# Altium schematic sheet 04_Ethernet.SchDoc
size A3; SheetNumber: 4; SheetTotal: 12
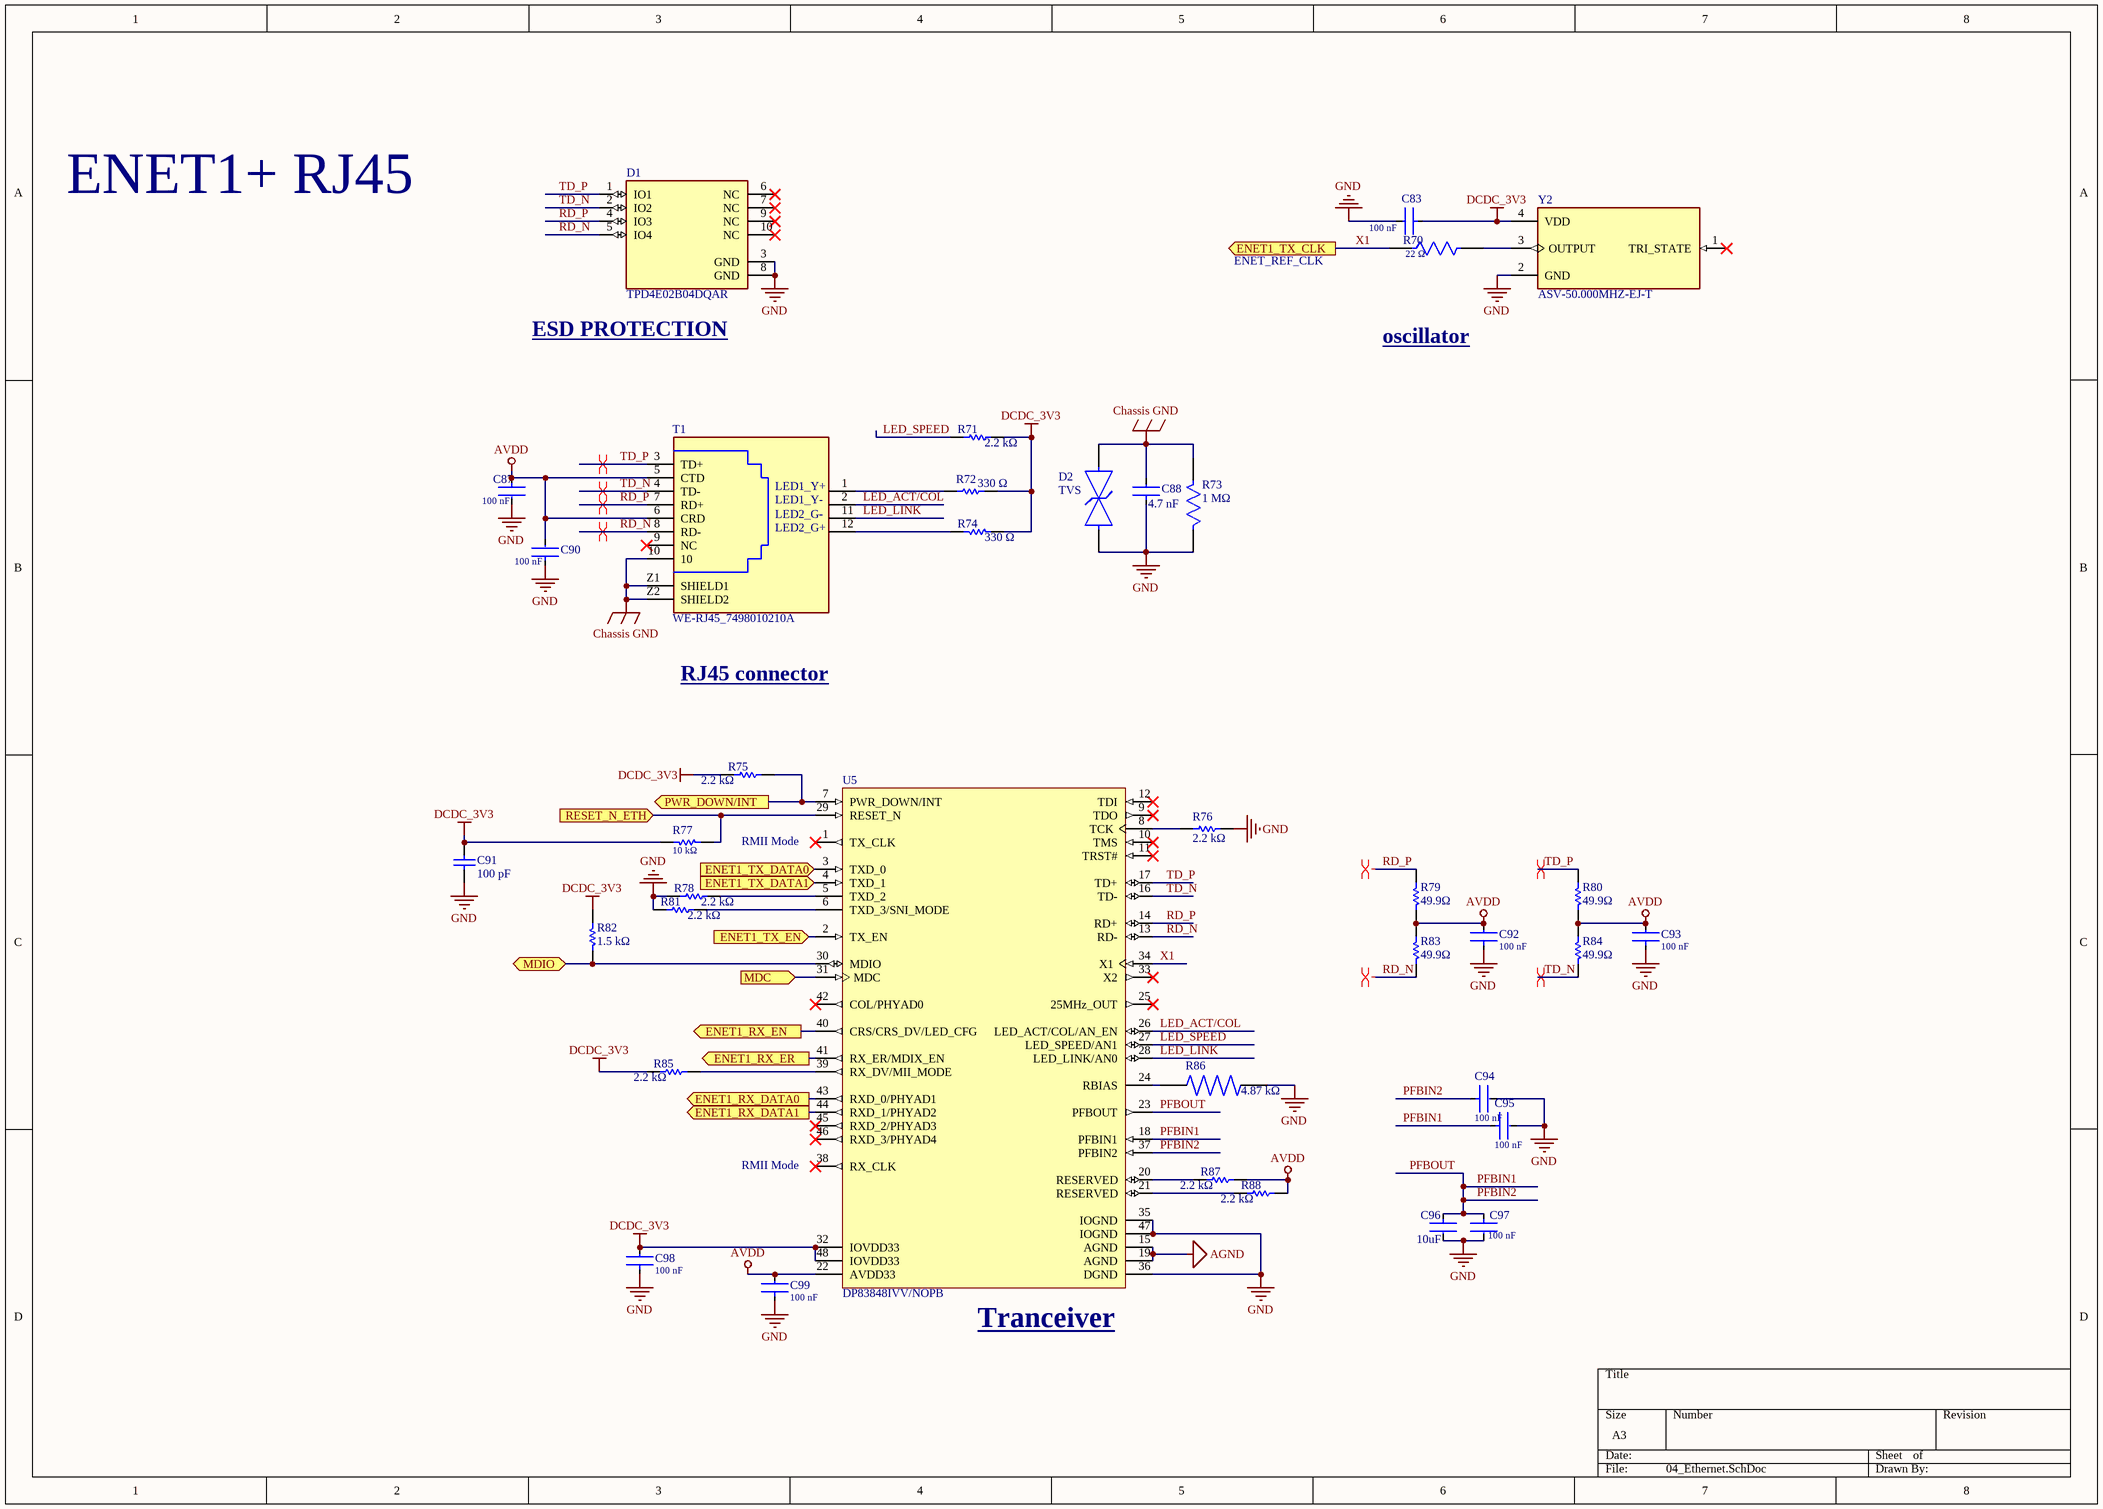
[diagram p0: 04_Ethernet.SchDoc]

## Parts
C83  100 nF  [FP-CC0603-DA-MFG]
C87  100 nF  [FP-CC0603-DA-MFG]
C88  4.7 nF  [FP-C1210C472KGRAC7800-MFG]
C90  100 nF  [FP-CC0603-DA-MFG]
C91  100 pF  [CAPC1608X90X40ML10T20]
C92  100 nF  [FP-CC0603-DA-MFG]
C93  100 nF  [FP-CC0603-DA-MFG]
C94  100 nF  [FP-CC0603-DA-MFG]
C95  100 nF  [FP-CC0603-DA-MFG]
C96  10uF  [FP-CC0603-DC-IPC_C]
C97  100 nF  [FP-CC0603-DA-MFG]
C98  100 nF  [FP-CC0603-DA-MFG]
C99  100 nF  [FP-CC0603-DA-MFG]
D1  TPD4E02B04DQAR  [FP-DQA0010A-MFG]
D2  TVS  [FP-SMBJ-CA-MFG]
R70  22 Ω  [FP-RC0603-0_55-IPC_C]
R71  2.2 kΩ  [RESC1608X55X25LL10T15]
R72  330 Ω  [RESC1608X55X25ML10T15]
R73  1 MΩ  [FP-CRCW1206-e3-MFG]
R74  330 Ω  [RESC1608X55X25ML10T15]
R75  2.2 kΩ  [RESC1608X55X25LL10T15]
R76  2.2 kΩ  [RESC1608X55X25LL10T15]
R77  10 kΩ  [RESC1608X55X25ML10T15]
R78  2.2 kΩ  [RESC1608X55X25LL10T15]
R79  49.9Ω  [RESC1608X55X25ML10T15]
R80  49.9Ω  [RESC1608X55X25ML10T15]
R81  2.2 kΩ  [RESC1608X55X25LL10T15]
R82  1.5 kΩ  [RESC1608X55X25ML10T15]
R83  49.9Ω  [RESC1608X55X25ML10T15]
R84  49.9Ω  [RESC1608X55X25ML10T15]
R85  2.2 kΩ  [RESC1608X55X25LL10T15]
R86  4.87 kΩ  [RESC1608X55N]
R87  2.2 kΩ  [RESC1608X55X25LL10T15]
R88  2.2 kΩ  [RESC1608X55X25LL10T15]
T1  WE-RJ45_7498010210A  [J00-00XXNL]
U5  DP83848IVV/NOPB  [PT0048A_N]
Y2  ASV-50.000MHZ-EJ-T  [ASV-50.000MHZ-EJ-T_ABR]

## Ports
ENET1_RX_DATA0 (out), ENET1_RX_DATA1 (out), ENET1_RX_EN (out), ENET1_RX_ER (out), ENET1_TX_CLK (out), ENET1_TX_DATA0 (in), ENET1_TX_DATA1 (in), ENET1_TX_EN (in), MDC (in), MDIO (bidir), PWR_DOWN/INT (out), RESET_N_ETH (in)

## Nets
AGND: U5.15(AGND) U5.19(AGND)
AVDD: C87.1 C90.2 C92.2 C93.2 C99.2 R79.1 R80.1 R83.2 R84.2 R87.2 R88.2 T1.5(CTD) T1.6(CRD) U5.22(AVDD33)
Chassis GND: C88.2 D2.2 R73.2 T1.10 T1.Z1(SHIELD1) T1.Z2(SHIELD2)
DCDC_3V3: C83.1 C91.2 C98.2 R71.2 R72.2 R74.2 R75.2 R77.2 R82.2 R85.1 U5.32(IOVDD33) U5.48(IOVDD33) Y2.4(VDD)
GND: C83.2 C87.2 C88.1 C90.1 C91.1 C92.1 C93.1 C94.2 C95.2 C96.2 C97.2 C98.1 C99.1 D1.3(GND) D1.8(GND) D2.1 R73.1 R76.2 R78.1 R81.1 R86.2 U5.35(IOGND) U5.36(DGND) U5.47(IOGND) Y2.2(GND)
ENET1_RX_DATA0: U5.43(RXD_0/PHYAD1) ; port ENET1_RX_DATA0
ENET1_RX_DATA1: U5.44(RXD_1/PHYAD2) ; port ENET1_RX_DATA1
ENET1_RX_EN: U5.40(CRS/CRS_DV/LED_CFG) ; port ENET1_RX_EN
ENET1_RX_ER: U5.41(RX_ER/MDIX_EN) ; port ENET1_RX_ER
ENET1_TX_DATA0: U5.3(TXD_0) ; port ENET1_TX_DATA0
ENET1_TX_DATA1: U5.4(TXD_1) ; port ENET1_TX_DATA1
ENET1_TX_EN: U5.2(TX_EN) ; port ENET1_TX_EN
LED_ACT/COL: T1.2(LED1_Y-) U5.26(LED_ACT/COL/AN_EN)
LED_LINK: T1.11(LED2_G-) U5.28(LED_LINK/AN0)
LED_SPEED: R71.1 U5.27(LED_SPEED/AN1)
MDC: U5.31(MDC) ; port MDC
MDIO: R82.1 U5.30(MDIO) ; port MDIO
PFBIN1: C94.1 C95.1 C96.1 C97.1 U5.18(PFBIN1) U5.23(PFBOUT) U5.37(PFBIN2)  [also labelled PFBIN2, PFBOUT]
PWR_DOWN/INT: R75.1 U5.7(PWR_DOWN/INT) ; port PWR_DOWN/INT
RD_N: D1.5(IO4) R83.1 T1.8(RD-) U5.13(RD-)
RD_P: D1.4(IO3) R79.2 T1.7(RD+) U5.14(RD+)
RESET_N_ETH: R77.1 U5.29(RESET_N) ; port RESET_N_ETH
TD_N: D1.2(IO2) R84.1 T1.4(TD-) U5.16(TD-)
TD_P: D1.1(IO1) R80.2 T1.3(TD+) U5.17(TD+)
X1: R70.1 U5.34(X1) ; port ENET1_TX_CLK
NetR70_2: R70.2 Y2.3(OUTPUT)
NetR72_1: R72.1 T1.1(LED1_Y+)
NetR74_1: R74.1 T1.12(LED2_G+)
NetR76_1: R76.1 U5.8(TCK)
NetR78_2: R78.2 U5.5(TXD_2)
NetR81_2: R81.2 U5.6(TXD_3/SNI_MODE)
NetR85_2: R85.2 U5.39(RX_DV/MII_MODE)
NetR86_1: R86.1 U5.24(RBIAS)
NetR87_1: R87.1 U5.20(RESERVED)
NetR88_1: R88.1 U5.21(RESERVED)

Not connected (* = marked no-connect by the designer): D1 6(NC)* 7(NC)* 9(NC)* 10(NC)*; T1 9(NC)*; U5 1(TX_CLK)* 9(TDO)* 10(TMS)* 11(TRST#)* 12(TDI)* 25(25MHz_OUT)* 33(X2)* 38(RX_CLK)* 42(COL/PHYAD0)* 45(RXD_2/PHYAD3)* 46(RXD_3/PHYAD4)*; Y2 1(TRI_STATE)*

## Layout directives
differential pair: RD_N, RD_P, TD_N, TD_P

## Notes on the sheet
- ENET1+ RJ45
- ENET_REF_CLK
- (near D1) ESD PROTECTION
- oscillator
- RJ45 connector
- RMII Mode
- (near U5) RMII Mode
- (near U5) Tranceiver

## Library data of the parts
C83 C87 C90 C92-C95 C97-C99 = CMP-2100-03601-2: CAP CER 0.1UF 50V X7R 0603; Manufacturer: YAGEO; Manufacturer Part Number: CC0603KRX7R9BB104; Material: Ceramic; Temperature Coefficient: 15%; Tolerance: 0.1; Height: 0.9mm; Voltage: 50 V; ComponentLink2Description: Datasheet; Device Class L2: Capacitors; Temperature Range High: +125°C; Category: Cap; Capacitance: 100 nF; Footprint Url: http://www.yageo.com/exep/pages/download/literatures/UPY-C_GEN_24.pdf; ComponentLink2URL: http://www.yageo.com/documents/recent/UPY-GPHC_X7R_6.3V-to-50V_18.pdf; Package: CC0603-DA; Temperature: -55°C to +125°C; Voltage Rating: 50 V; Temperature Characteristic: X7R; Device Class L1: Passive Components; Temperature Range Low: -55°C; RoHS: TRUE; Automotive: No; Value: 100 nF; Device Class L3: Ceramic Capacitors; Octopart: https://octopart.com/cc0603krx7r9bb104-yageo-42244635; Mouser Description: Multilayer Ceramic Capacitor, CC Series, 0.1 - F, - 10%, X7R, 50 V, 0603 [1608 Metric]; Lead Free: Yes; Digikey Description: CAP CER 0.1UF 50V X7R 0603
C88 = CMP-03020-034683-2: CAP CER 4700PF 2KV X7R 1210; NexarPartId: 17605740; Material: Ceramic; Capacitance: 4.7nF; Tolerance: 10%; Dissipation Factor: 2.5%; Thickness: 2.3114mm; Length: 3.2mm; Voltage Rating: 2kV; Mount: Surface Mount; REACH SVHC: No SVHC; Depth: 2.5mm; Min Operating Temperature: -55°C; Width: 2.5mm; Dielectric Material: Ceramic; Termination: SMD/SMT; Dielectric: X7R; Case Code (Imperial): 1210; Case/Package: 1210; Voltage Rating (DC): 2kV; Case Code (Metric): 3225; Packaging: Tape and Reel; Schedule B: 8532240020, 8532240020; Max Operating Temperature: 125°C; RoHS: Compliant; Height: 2.1mm
C91 = CMP-2100-03594-1: Chip Capacitor, 100 pF, +/- 5%, 50 V, -55 to 125 degC, 0603 (1608 Metric), RoHS, Tape and Reel; Manufacturer: Yageo; Capacitance: 100pF; Voltage Rating (DC): 50V; Dielectric: C0G; Temperature Coefficient: 30ppm/degC; Insulation Resistance: 100GR; Datasheet Version: Rev. 14, 07/2016; Manufacturer URL: http://www.yageo.com/; Packaging: TapeandReel; Mount: SurfaceMount; RoHSCompliant: True; Package Reference: 0603; Tolerance: 5%; Max Operating Temperature: 125degC; Case Code (Imperial): 0603; Number of Pins: 2; Width: 0.8mm; Case Code (Metric): 1608; Voltage: 50V; REACH SVHC: Unknown; Package Description: 2-Pin Surface Mount Device, Body 1.6 x 0.8 mm; Composition: Ceramic; Lead Free: LeadFree; Min Operating Temperature: -55degC; Radiation Hardening: No; Depth: 0.8mm; Thickness: 0.035inch; Datasheet URL: http://www.yageo.com/documents/recent/UPY-GP_NP0_16V-to-50V_14.pdf; Termination: SMD/SMT; Package Quantity: 1; Length: 1.6mm; Voltage Rating: 50V; Height: 0.8mm; Case/Package: 0603
C96 = CMP-03422-001507-1: CAP CER 10UF 10V X5R 0603; Tolerance: 10%; Case/Package: 0603; Length: 0.063inch; Capacitance: 10uF; Dielectric: X5R; Mount: Surface Mount; Case Code (Metric): 1608; Depth: 0.8mm; Voltage Rating (DC): 10V; Voltage Rating: 10V; Lead Free: Lead Free; Resistor Type: Ceramic; Packaging: Tape and Reel; Max Operating Temperature: 85°C; Termination: SMD/SMT; Min Operating Temperature: -55°C; Weight: 7.1E-05oz; Thickness: 0.035inch; Case Code (Imperial): 0603; Package Quantity: 4000; Halogen Free: Halogen Free; RoHS Compliant: Yes; Width: 0.031inch
D1 = CMP-04989-000015-1: TVS DIODE 3.6V 8.8V 10USON; Number of Bidirectional Channels: 4; Peak Pulse Current: 5A; Power Line Protection: No; Peak Pulse Power: 17W; Min Breakdown Voltage: 5.5V; Interface: USB; Resistor Type: Zener; Number of Pins: 10; Lead Free: Lead Free; Clamping Voltage: 8.8V; RoHS Compliant: Yes; Min Operating Temperature: -40°C; REACH SVHC: No SVHC; Max Operating Temperature: 125°C; Packaging: Cut Tape; Operating Supply Voltage: 3.6V; Reverse Standoff Voltage: 3.6V; Number of Channels: 4; Mount: Surface Mount
D2 = CMP-07401-000032-1: TVS DIODE 28VWM 45.4VC SMB; Polarity: Bidirectional; Max Surge Current: 100A; Max Breakdown Voltage: 35.8V; Number of Elements: 1; Peak Pulse Current: 13.2A; Element Configuration: Single; Power Line Protection: No; Min Breakdown Voltage: 31.1V; Clamping Voltage: 45.4V; ESD Protection: Yes; Max Reverse Leakage Current: 5uA; Max Power Dissipation: 600W; Reverse Standoff Voltage: 28V; Test Current: 1mA; Diode Type: ZENER; Operating Supply Voltage: 3.5V; Radiation Hardening: No; Resistor Type: Zener; REACH SVHC: No SVHC; Height: 2.42mm; Max Operating Temperature: 150°C; RoHS Compliant: Yes; Packaging: Tape and Reel; Min Operating Temperature: -55°C; Length: 4.57mm; Termination: SMD/SMT; Leakage Current: 5uA; Width: 3.94mm; Number of Channels: 1; Number of Bidirectional Channels: 1; Direction: Bidirectional; Case/Package: DO-214AA; Package Quantity: 1; Series: SMBJ; Number of Pins: 2; Mount: Surface Mount; Breakdown Voltage: 35.8V; Peak Pulse Power: 600W; Reverse Breakdown Voltage: 31.1V
R70 = CMP-03412-037819-1: RES SMD 22 OHM 5% 1/10W 0603; Temperature Coefficient: 100ppm/°C; Max Power Dissipation: 100mW; Voltage Rating: 50V; Resistance: 22R; Length: 1.6mm; Tolerance: 5%; Resistance Tolerance: 5%; Number of Terminations: 2; Construction: Rectangular; Min Operating Temperature: -55°C; Lead Free: Lead Free; Width: 0.8mm; Case Code (Imperial): 0603; Voltage Rating (DC): 50V; Case/Package: 0603; Features: Moisture Resistant; REACH SVHC: No SVHC; Military Standard: Not; RoHS Compliant: Yes; Max Operating Temperature: 155°C; Number of Pins: 2; Termination: SMD/SMT; Case Code (Metric): 1608; Packaging: Tape and Reel; Resistor Type: Thick Film; Depth: 0.8mm; Size Code: 0603; Power Rating: 100mW; Series: RC
R71 R75 R76 R78 R81 R85 R87 R88 = CMP-2000-06934-1: Thick Film Resistor, 2.2 KOhm, 100 mW, 50 V, +/- 1%, -55 to 155 degC, 2-Pin SMD (0603), RoHS, Tape and Reel; Manufacturer: Yageo; Resistance: 2.2kOhms; Temperature Coefficient: 100PPM/C; Voltage Rating: 50V; Power Rating: 100mW; Tolerance: 1%; Datasheet Version: Rev. 7, 05/2017; Case Code - mm: 1608; Series: RC; Mounting Technology: SurfaceMount; Package Description: 2-Pin Surface Mount Device, Body 1.6 x 0.8 mm; Case Code - in: 0603; Package Reference: 0603; Product: ThickFilmResistorsGeneralPurpose; Manufacturer URL: http://www.yageo.com/; Termination Style: SMD/SMT; Operating Temperature Range: -55Cto+155C; Datasheet URL: http://www.yageo.com/documents/recent/PYu-RC_Group_51_RoHS_L_7.pdf; Packaging: Reel
R72 R74 = CMP-1659-00020-2: Chip Resistor, 330 Ohm, +/- 1%, 0.1 W, -55 to 155 degC, 0603 (1608 Metric), RoHS, Tape and Reel; Tolerance: 10%; ESR: 800 mohm; Voltage Rating (DC): 16 V; Capacitance: 47 uF; Length: 7.3 mm; ComponentLink1URL: http://www.yageo.com/; Packaging: Tape and Reel; Pins: 2; ComponentLink1Description: Manufacturer URL; Case Code (Imperial): 2917; REACH SVHC: No SVHC; Width: 4.3 mm; ComponentLink2Description: Datasheet; Voltage Rating: 16 V; RoHSCompliant: True; Max Operating Temperature: 125degC; ComponentLink2URL: http://www.yageo.com/documents/recent/PYu-RC_Group_51_RoHS_L_04.pdf; Min Operating Temperature: -55degC; Case/Package: 2917; Radiation Hardening: No; DatasheetVersion: Rev. 4, 02/2016; Mount: Surface Mount; PackageReference: 0603; Package Quantity: 500; Case Code (Metric): 7343; PackageDescription: 2-Pin Surface Mount Device, Body 1.6 x 0.8 mm; Height: 3.1 mm
R73 = CMP-2003-01906-2: RES Thick Film, 1MΩ, 1%, 0.25W, 100ppm/°C, 1206; Voltage Rating (DC): 200V; Max Power Dissipation: 250mW; Resistance: 1MR; Package Quantity: 10; Case Code (Imperial): 1206; Weight: 0.000353oz; Height: 0.024inch; Number of Terminations: 2; Case/Package: 1206; Length: 3.2mm; Military Standard: Not; Features: Automotive AEC-Q200; Voltage Rating: 200V; Termination: SMD/SMT; Tolerance: 1%; Lead Free: Lead Free; Number of Pins: 2; Composition: Thick Film; Width: 0.063inch; Temperature Coefficient: 100ppm/°C; Packaging: Tape and Reel; Min Operating Temperature: -55°C; Max Operating Temperature: 155°C; Case Code (Metric): 3216; Contact Plating: Tin; Depth: 1.6mm; Radiation Hardening: No; Power Rating: 250mW; Working Voltage: 200V
R77 = CMP-2000-05022-1: Resistor, 10 KOhm, +/- 5%, 100 mW, -55 to 155 degC, 0603 (1608 Metric), RoHS, Tape and Reel; Manufacturer: Yageo; Resistance: 10kOhms; Voltage Rating: 50V; Temperature Coefficient: 100PPM/C; Power Rating: 100mW; Package Reference: 603; Series: RC; Case Code - mm: 1608; Packaging: Reel; Datasheet URL: http://www.farnell.com/datasheets/443971.pdf; Datasheet Version: Rev. 4, 04/2009; Operating Temperature Range: -55Cto+155C; Product: ThickFilmResistorsGeneralPurpose; Package Description: 2-Pin Surface Mount Device, Body 1.6 x 0.8 mm; Manufacturer URL: http://www.yageo.com/; Case Code - in: 0603; Tolerance: 5%; Termination Style: SMD/SMT
R79 R80 R83 R84 = CMP-1659-00036-1: General Purpose Chip Resistor, 49.9 Ohm, +/- 1%, -55 to 155 degC, 0603 (1608 Metric), RoHS, Tape and Reel; Max Supply Voltage: 3.63 V; Case\Package: LQFP; Interface: SPI; Min Supply Voltage: 2.97 V; PackageReference: 0603; Packaging: Tray; ComponentLink2Description: Datasheet; ComponentLink1Description: Manufacturer URL; ComponentLink2URL: https://datasheet.ciiva.com/11808/0900766b80f96399-11808223.pdf; RoHSCompliant: true; Max Operating Temperature: 85 degC; ComponentLink1URL: http://www.yageo.com/; PackageDescription: 2-Pin Surface Mount Device, Body 1.6 x 0.8 mm; DatasheetVersion: Rev. 4, 04/2009; Min Operating Temperature: -40 degC; Package Quantity: 250; Pins: 48
R82 = CMP-2100-03665-1: Chip Resistor, 1.5 KOhm, +/- 1%, 0.1 W, -55 to 155 degC, 0603 (1608 Metric), RoHS, Tape and Reel; Manufacturer: Yageo; Power Rating: 100mW; Voltage Rating: 50V; Temperature Coefficient: 100ppm/degreesC; Military Standard: Not; Datasheet URL: http://www.yageo.com/NewPortal/yageodocoutput?fileName=/pdf/R-Chip/PYu-RC_Group_51_RoHS_L_5.pdf; Package Description: 2-Pin Surface Mount Device, Body 1.6 x 0.8 mm; Composition: ThickFilm; Case Code (Metric): 1608; Case/Package: 0603; Number of Terminations: 2; Depth: 0.8mm; Height: 0.022inch; Manufacturer URL: http://www.yageo.com/; Lead Free: LeadFree; Min Operating Temperature: -55degC; Max Operating Temperature: 155degC; Datasheet Version: Rev. 5, 10/2016; RoHSCompliant: true; Max Power Dissipation: 100mW; Packaging: TapeandReel; Voltage Rating (DC): 50V; Length: 0.063inch; Tolerance: 1%; Width: 0.031inch; Number of Pins: 2; Termination: SMD/SMT; Package Reference: 0603; Package Quantity: 1; Case Code (Imperial): 0603; Resistance: 1.5KOhm; REACH SVHC: NoSVHC
R86 = RC0603FR-074K87L: 4.87 kOhms Â±1% 0.1W, 1/10W Chip Resistor 0603 (1608 Metric) Moisture Resistant Thick Film; MF: Yageo; SnapEDA_Link: https://www.snapeda.com/parts/RC0603FR-074K87L/Yageo/view-part/?ref=snap; Package: 1608 Yageo; Value: *; MP: RC0603FR-074K87L; Check_prices: https://www.snapeda.com/parts/RC0603FR-074K87L/Yageo/view-part/?ref=eda
T1 = WE-RJ45_7498010210A: RJ45 CONN, JACK, 8P8C, 1PORT, SMT ROHS COMPLIANT: YES; MF: WÃ¼rth Elektronik; SnapEDA_Link: https://www.snapeda.com/parts/7498010210A/W%25C3%25BCrth+Elektronik+Midcom/view-part/?ref=snap; Package: None; Value: *; MP: 7498010210A; Check_prices: https://www.snapeda.com/parts/7498010210A/W%25C3%25BCrth+Elektronik+Midcom/view-part/?ref=eda
U5 = CMP-0058-00752-4: PHYTER® Industrial Temperature Single Port 10/100 Mb/s Ethernet Physical Layer Transceiver, 48-pin LQFP, Pb-Free, 250 Tray; Manufacturer: Texas Instruments; CompType: Interface IC; High-Reliability: Y; PowerWise: N; PackageTopMarking: NSUZXYTT*DP83848VV*VBI; RoHS: Y; PackageReference: PT0048A; ComponentLink1Description: Datasheet URL; PartNumber: DP83848IVV/NOPB; PinCount: 48; ComponentLink1URL: http://www.ti.com/general/docs/lit/getliterature.tsp?genericPartNumber=DP83848I&fileType=pdf; PackageDescription: LQFP, 7 x 7 x 1.4mm, 48 Lead, 0.5mm Pitch
Y2 = ASV-50.000MHZ-EJ-T: Package: None; Value: *; Availability: Unavailable; Price: None; MP: ASV-50.000MHZ-EJ-T